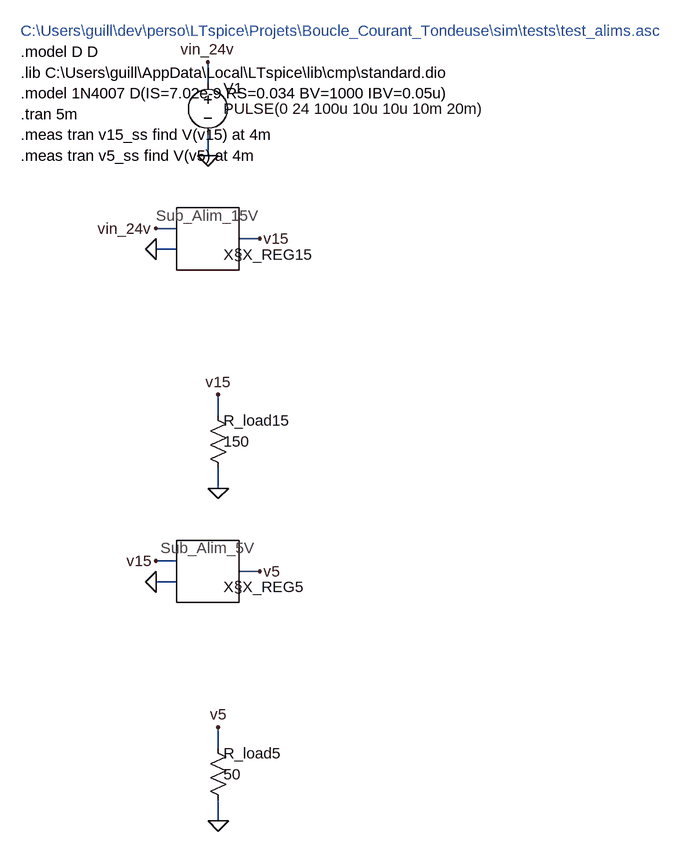
[diagram p0: schematic test_alims.asc]
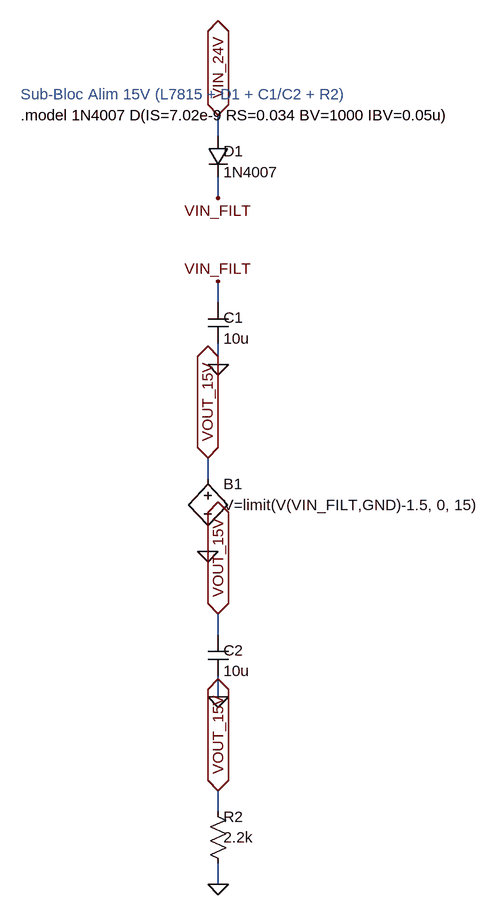
[diagram p1: sub-circuit sub_alim_15v.asc]
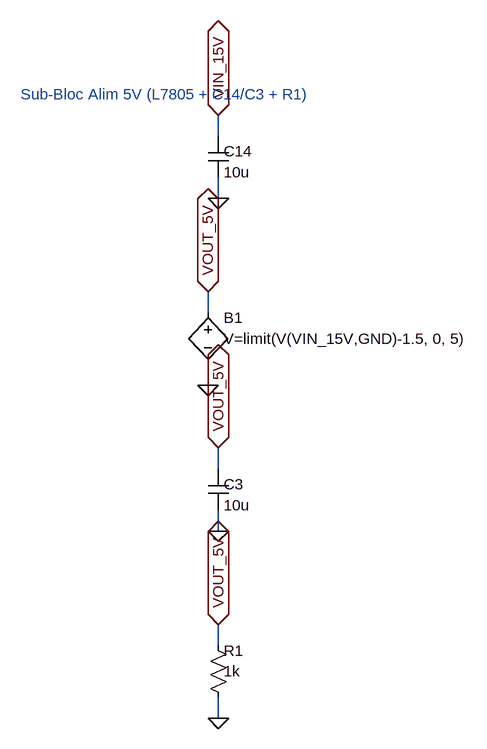
[diagram p2: sub-circuit sub_alim_5v.asc]
test_alims.asc, the LTspice schematic file:
Version 4
SHEET 1 3200 2400
TEXT 32 32 Left 2 ;C:\Users\guill\dev\perso\LTspice\Projets\Boucle_Courant_Tondeuse\sim\tests\test_alims.asc
TEXT 32 64 Left 2 !.model D D
TEXT 32 96 Left 2 !.lib C:\Users\guill\AppData\Local\LTspice\lib\cmp\standard.dio
TEXT 32 128 Left 2 !.model 1N4007 D(IS=7.02e-9 RS=0.034 BV=1000 IBV=0.05u)
TEXT 32 160 Left 2 !.tran 5m
TEXT 32 192 Left 2 !.meas tran v15_ss find V(v15) at 4m
TEXT 32 224 Left 2 !.meas tran v5_ss find V(v5) at 4m
SYMBOL voltage 320 96 R0
WINDOW 0 24 24 Left 2
WINDOW 3 24 56 Left 2
SYMATTR InstName V1
SYMATTR Value PULSE(0 24 100u 10u 10u 10m 20m)
WIRE 320 112 320 80
FLAG 320 80 vin_24v
WIRE 320 192 320 224
FLAG 320 224 0
SYMBOL ..\blocks\sub_alim_15v 320 352 R0
WINDOW 0 24 24 Left 2
WINDOW 3 24 56 Left 2
SYMATTR InstName X§X_REG15
WIRE 272 336 240 336
FLAG 240 336 vin_24v
WIRE 272 368 240 368
FLAG 240 368 0
WIRE 368 352 400 352
FLAG 400 352 v15
SYMBOL res 320 608 R0
WINDOW 0 24 24 Left 2
WINDOW 3 24 56 Left 2
SYMATTR InstName R_load15
SYMATTR Value 150
WIRE 336 624 336 592
FLAG 336 592 v15
WIRE 336 704 336 736
FLAG 336 736 0
SYMBOL ..\blocks\sub_alim_5v 320 864 R0
WINDOW 0 24 24 Left 2
WINDOW 3 24 56 Left 2
SYMATTR InstName X§X_REG5
WIRE 272 848 240 848
FLAG 240 848 v15
WIRE 272 880 240 880
FLAG 240 880 0
WIRE 368 864 400 864
FLAG 400 864 v5
SYMBOL res 320 1120 R0
WINDOW 0 24 24 Left 2
WINDOW 3 24 56 Left 2
SYMATTR InstName R_load5
SYMATTR Value 50
WIRE 336 1136 336 1104
FLAG 336 1104 v5
WIRE 336 1216 336 1248
FLAG 336 1248 0

sub_alim_15v.asc, the sub-circuit schematic file:
Version 4
SHEET 1 3200 2400
TEXT 32 32 Left 2 ;Sub-Bloc Alim 15V (L7815 + D1 + C1/C2 + R2)
TEXT 32 64 Left 2 !.model 1N4007 D(IS=7.02e-9 RS=0.034 BV=1000 IBV=0.05u)
SYMBOL diode 320 96 R0
WINDOW 0 24 24 Left 2
WINDOW 3 24 56 Left 2
SYMATTR InstName D1
SYMATTR Value 1N4007
WIRE 336 96 336 64
FLAG 336 64 VIN_24V
IOPIN 336 64 BiDir
WIRE 336 160 336 192
FLAG 336 192 VIN_FILT
SYMBOL cap 320 352 R0
WINDOW 0 24 24 Left 2
WINDOW 3 24 56 Left 2
SYMATTR InstName C1
SYMATTR Value 10u
WIRE 336 352 336 320
FLAG 336 320 VIN_FILT
WIRE 336 416 336 448
FLAG 336 448 0
IOPIN 336 448 BiDir
SYMBOL bv 320 608 R0
WINDOW 0 24 24 Left 2
WINDOW 3 24 56 Left 2
SYMATTR InstName B1
SYMATTR Value V=limit(V(VIN_FILT,GND)-1.5, 0, 15)
WIRE 320 624 320 592
FLAG 320 592 VOUT_15V
IOPIN 320 592 BiDir
WIRE 320 704 320 736
FLAG 320 736 0
IOPIN 320 736 BiDir
SYMBOL cap 320 864 R0
WINDOW 0 24 24 Left 2
WINDOW 3 24 56 Left 2
SYMATTR InstName C2
SYMATTR Value 10u
WIRE 336 864 336 832
FLAG 336 832 VOUT_15V
IOPIN 336 832 BiDir
WIRE 336 928 336 960
FLAG 336 960 0
IOPIN 336 960 BiDir
SYMBOL res 320 1120 R0
WINDOW 0 24 24 Left 2
WINDOW 3 24 56 Left 2
SYMATTR InstName R2
SYMATTR Value 2.2k
WIRE 336 1136 336 1104
FLAG 336 1104 VOUT_15V
IOPIN 336 1104 BiDir
WIRE 336 1216 336 1248
FLAG 336 1248 0
IOPIN 336 1248 BiDir

sub_alim_5v.asc, the sub-circuit schematic file:
Version 4
SHEET 1 3200 2400
TEXT 32 32 Left 2 ;Sub-Bloc Alim 5V (L7805 + C14/C3 + R1)
SYMBOL cap 320 96 R0
WINDOW 0 24 24 Left 2
WINDOW 3 24 56 Left 2
SYMATTR InstName C14
SYMATTR Value 10u
WIRE 336 96 336 64
FLAG 336 64 VIN_15V
IOPIN 336 64 BiDir
WIRE 336 160 336 192
FLAG 336 192 0
IOPIN 336 192 BiDir
SYMBOL bv 320 352 R0
WINDOW 0 24 24 Left 2
WINDOW 3 24 56 Left 2
SYMATTR InstName B1
SYMATTR Value V=limit(V(VIN_15V,GND)-1.5, 0, 5)
WIRE 320 368 320 336
FLAG 320 336 VOUT_5V
IOPIN 320 336 BiDir
WIRE 320 448 320 480
FLAG 320 480 0
IOPIN 320 480 BiDir
SYMBOL cap 320 608 R0
WINDOW 0 24 24 Left 2
WINDOW 3 24 56 Left 2
SYMATTR InstName C3
SYMATTR Value 10u
WIRE 336 608 336 576
FLAG 336 576 VOUT_5V
IOPIN 336 576 BiDir
WIRE 336 672 336 704
FLAG 336 704 0
IOPIN 336 704 BiDir
SYMBOL res 320 864 R0
WINDOW 0 24 24 Left 2
WINDOW 3 24 56 Left 2
SYMATTR InstName R1
SYMATTR Value 1k
WIRE 336 880 336 848
FLAG 336 848 VOUT_5V
IOPIN 336 848 BiDir
WIRE 336 960 336 992
FLAG 336 992 0
IOPIN 336 992 BiDir

The netlist it stands for:
* test_alims.asc
V1 vin_24v 0 PULSE(0 24 100u 10u 10u 10m 20m)
XX§X_REG15 vin_24v 0 v15 sub_alim_15v
R_load15 v15 0 150
XX§X_REG5 v15 0 v5 sub_alim_5v
R_load5 v5 0 50

* block symbol definitions
.subckt sub_alim_15v VIN_24V GND VOUT_15V
D1 VIN_24V VIN_FILT 1N4007
C1 VIN_FILT 0 10u
B1 VOUT_15V 0 V=limit(V(VIN_FILT,GND)-1.5, 0, 15)
C2 VOUT_15V 0 10u
R2 VOUT_15V 0 2.2k
* Sub-Bloc Alim 15V (L7815 + D1 + C1/C2 + R2)
.model 1N4007 D(IS=7.02e-9 RS=0.034 BV=1000 IBV=0.05u)
.ends sub_alim_15v

.subckt sub_alim_5v VIN_15V GND VOUT_5V
C14 VIN_15V 0 10u
B1 VOUT_5V 0 V=limit(V(VIN_15V,GND)-1.5, 0, 5)
C3 VOUT_5V 0 10u
R1 VOUT_5V 0 1k
* Sub-Bloc Alim 5V (L7805 + C14/C3 + R1)
.ends sub_alim_5v

.model D D
.lib standard.dio
* C:\Users\guill\dev\perso\LTspice\Projets\Boucle_Courant_Tondeuse\sim\tests\test_alims.asc
.model D D
.lib C:\Users\guill\AppData\Local\LTspice\lib\cmp\standard.dio
.model 1N4007 D(IS=7.02e-9 RS=0.034 BV=1000 IBV=0.05u)
.tran 5m
.meas tran v15_ss find V(v15) at 4m
.meas tran v5_ss find V(v5) at 4m
.backanno
.end